# Altium schematic sheet 10_Power_Management.SchDoc: Gestión de energía
size A4; DrawnBy: Mateo Cárdenas; Revision: Rev A; SheetNumber: 2; SheetTotal: 7
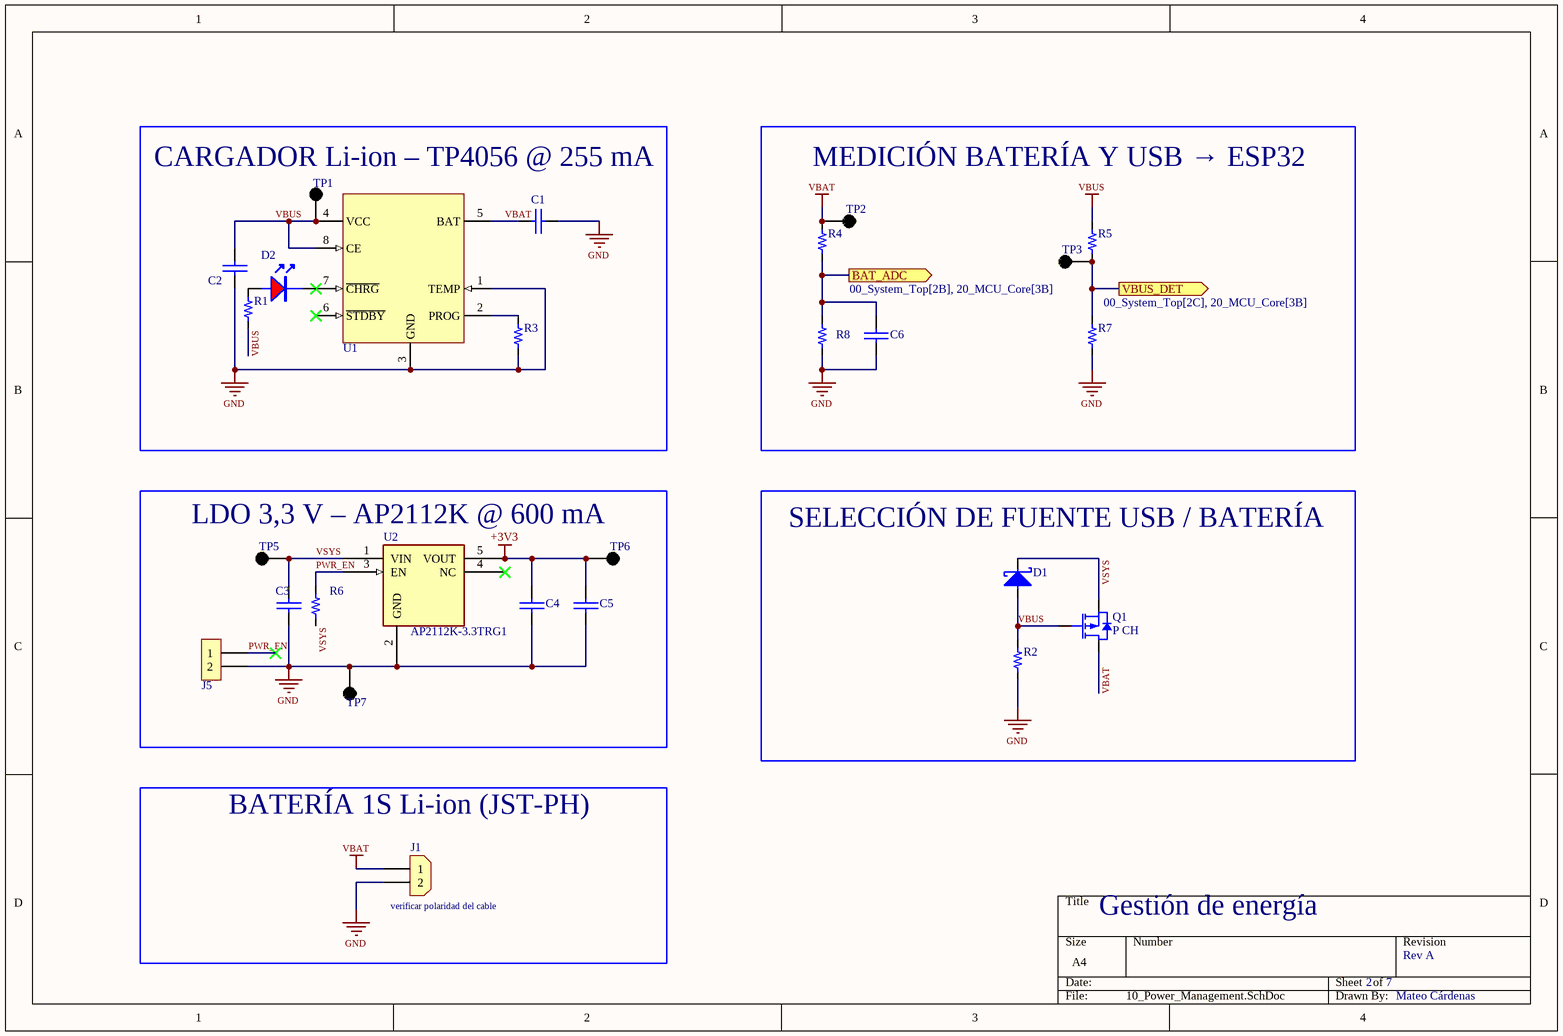
[diagram p0: 10_Power_Management.SchDoc]

## Parts
C1  10uF 10V  [0603_cap]  (value not drawn)
C2  10uF 10V  [0603_cap]  (value not drawn)
C3  10uF 10V  [0603_cap]  (value not drawn)
C4  10uF 10V  [0603_cap]  (value not drawn)
C5  0.1uF 50V  [0603_cap]  (value not drawn)
C6  0.1uF 50V  [0603_cap]  (value not drawn)
D1  40V 1A  [SOD_123]  (value not drawn)
D2  2V  [0805_LED]  (value not drawn)
J1  Connector 2pos  [CON_2x1_TH_2MM]  (value not drawn)
J5  2x1  [H_2x1_TH_100mil]  (value not drawn)  (no BOM)
Q1  P CH  [SOT_23_3]
R1  1k 1/10W  [0603_res]  (value not drawn)
R2  49k9 1/10W  [0603_res]  (value not drawn)
R3  4k7 1/10W  [0603_res]  (value not drawn)
R4  390k 1/10W  [0603_res]  (value not drawn)
R5  390k 1/10W  [0603_res]  (value not drawn)
R6  10k 1/10W  [0603_res]  (value not drawn)
R7  390k 1/10W  [0603_res]  (value not drawn)
R8  390k 1/10W  [0603_res]  (value not drawn)
TP1  Test Point  [Test Point]  (value not drawn)
TP2  Test Point  [Test Point]  (value not drawn)
TP3  Test Point  [Test Point]  (value not drawn)
TP5  Test Point  [Test Point]  (value not drawn)
TP6  Test Point  [Test Point]  (value not drawn)
TP7  Test Point  [Test Point]  (value not drawn)
U1  4.2V 1A  [SOIC_8_3.9mm]  (value not drawn)
U2  AP2112K-3.3TRG1  [SOT-23-5]

## Blocks framed on the sheet
CARGADOR Li-ion – TP4056 @ 255 mA: C1 C2 D2 R1 R3 TP1 U1
MEDICIÓN BATERÍA Y USB → ESP32: C6 R4 R5 R7 R8 TP2 TP3
LDO 3,3 V – AP2112K @ 600 mA: C3-C5 J5 R6 TP5-TP7 U2
SELECCIÓN DE FUENTE USB / BATERÍA: D1 Q1 R2
BATERÍA 1S Li-ion (JST-PH): J1

## Ports
BAT_ADC (out, see 00_System_Top[2B], 20_MCU_Core[3B]), VBUS_DET (out, see 00_System_Top[2C], 20_MCU_Core[3B])

## Nets
+3V3: C4.1 C5.1 TP6.1(TP?) U2.5(VOUT)
GND: C1.1 C2.2 C3.2 C4.2 C5.2 C6.1 J1.2 J5.2 R2.1 R3.1 R7.2 R8.1 TP7.1(TP?) U1.1(TEMP) U1.3(GND) U2.2(GND)
VBAT: C1.2 J1.1 Q1.3(D) R4.2 TP2.1(TP?) U1.5(BAT)
VBUS: C2.1 D1.2 Q1.1(G) R1.2 R2.2 R5.1 TP1.1(TP?) U1.4(VCC) U1.8(CE)
BAT_ADC: C6.2 R4.1 R8.2 ; port BAT_ADC
PWR_EN: J5.1 R6.2 U2.3(EN)
VBUS_DET: R5.2 R7.1 TP3.1(TP?) ; port VBUS_DET
VSYS: C3.1 D1.1 Q1.2(S) R6.1 TP5.1(TP?) U2.1(VIN)
NetD2_1: D2.1(A) R1.1
NetD2_2: D2.2 U1.7(~{CHRG})
NetR3_2: R3.2 U1.2(PROG)

Not connected (* = marked no-connect by the designer): U1 6(~{STDBY})*; U2 4(NC)*

## Notes on the sheet
- (near J1) verificar polaridad del cable

## Library data of the parts
C1-C4 = Cap_10uF_0603_10V: 10V 10uF X5R ±10% 0603 Multilayer Ceramic Capacitors MLCC - SMD/SMT ROHS; Manufacturer: CCTC; Manufacturer Part Number: TCC0603X5R106K100CT; Supplier 1: LCSC; Supplier Part Number 1: C380314; ComponentLink1Description: LCSC; ComponentLink1URL: https://www.lcsc.com/product-detail/Multilayer-Ceramic-Capacitors-MLCC-SMD-SMT_CCTC-TCC0603X5R106K100CT_C380314.html; Value: 10uF
C5 C6 = Cap_0.1uF_0603_50V: 50V 100nF Y5V -20%~+80% 0603 Multilayer Ceramic Capacitors MLCC - SMD/SMT ROHS; Manufacturer: Walsin Tech Corp; Manufacturer Part Number: 0603F104Z500CT; Supplier 1: LCSC; Supplier Part Number 1: C83060; ComponentLink1Description: LCSC; ComponentLink1URL: https://www.lcsc.com/product-detail/Multilayer-Ceramic-Capacitors-MLCC-SMD-SMT_Walsin-Tech-Corp-0603F104Z500CT_C83060.html; Value: 0.1uF
D1 = D_Schottky_40V_1A_SOD_123F: DIODE SCHOTTKY 40V 1A SOD123F; Manufacturer: Shanghai Prisemi Elec; Manufacturer Part Number: PSBD1DF40V1H; Supplier 1: LCSC; Supplier Part Number 1: C110730; ComponentLink1Description: LCSC; ComponentLink1URL: https://www.lcsc.com/product-detail/Switching-Diode_Shanghai-Prisemi-Elec-PSBD1DF40V1H_C110730.html
D2 = LED_0805_RED: LED RED CLEAR 0805 SMD; Manufacturer: XINGLIGHT; Manufacturer Part Number: XL-2012SURC; Supplier 1: LCSC; Supplier Part Number 1: C965812; ComponentLink1Description: LCSC; ComponentLink1URL: https://www.lcsc.com/product-detail/Light-Emitting-Diodes-LED_XINGLIGHT-XL-2012SURC_C965812.html
J1 = Con_2x1_TH_JST_2MM: 2POS 2MM; Manufacturer: JST; Manufacturer Part Number: S2B-PH-K-S(LF)(SN); Supplier 1: LCSC; Supplier Part Number 1: C173752; ComponentLink1Description: Digi-Key; ComponentLink1URL: https://lcsc.com/product-detail/Wire-To-Board-Connector_JST-S2B-PH-K-S-LF-SN_C173752.html
J5 = H_Male_2x1_TH_100mil: ComponentLink1Description: LCSC
Q1 = Q_PFET_30V_3A_SOT23: MOSFET P-CH 20V 3A SOT23; Manufacturer: ALLPOWER(ShenZhen Quan Li Semiconductor); Manufacturer Part Number: AP2301; Supplier 1: LCSC; Supplier Part Number 1: C385296; ComponentLink1Description: LCSC; ComponentLink1URL: https://www.lcsc.com/product-detail/MOSFETs_ALLPOWER-ShenZhen-Quan-Li-Semiconductor-AP2301_C385296.html
R1 = Res_1k_0603_1/10W: RES SMD 1k OHM 5% 1/10W 0603; Manufacturer: FOJAN; Manufacturer Part Number: FRC0603J102 TS; ComponentLink1URL: https://www.lcsc.com/product-detail/Chip-Resistor-Surface-Mount_FOJAN-FRC0603J102-TS_C2907113.html; Supplier 1: LCSC; Supplier Part Number 1: C2907113; ComponentLink1Description: LCSC; Value: 1k
R2 = Res_49k9_0603_1/10W: 100mW Thick Film Resistor 75V ±100ppm/℃ ±1% 49.9kΩ 0603 Chip Resistor - Surface Mount ROHS; Manufacturer: YAGEO; Manufacturer Part Number: RC0603FR-0749K9L; ComponentLink1URL: https://lcsc.com/product-detail/Chip-Resistor-Surface-Mount_YAGEO-RC0603FR-0749K9L_C114624.html; Supplier 1: LCSC; Supplier Part Number 1: C114624; ComponentLink1Description: LCSC; Value: 49k9
R3 = Res_4k7_0603_1/10W: 100mW Thick Film Resistor 75V ±1% 4.7kΩ 0603 Chip Resistor - Surface Mount ROHS; Manufacturer: VO; Manufacturer Part Number: SCR0603F4K7; ComponentLink1URL: https://lcsc.com/product-detail/Chip-Resistor-Surface-Mount_VO-SCR0603F4K7_C3016318.html; Supplier 1: LCSC; Supplier Part Number 1: C3016318; ComponentLink1Description: LCSC; Value: 4k7
R4 R5 R7 R8 = Res_390k_0603_1/10W: 100mW Thick Film Resistor 75V ±100ppm/℃ ±1% 390kΩ 0603 Chip Resistor - Surface Mount ROHS; Manufacturer: YAGEO; Manufacturer Part Number: RC0603FR-07390KL; ComponentLink1URL: https://lcsc.com/product-detail/Chip-Resistor-Surface-Mount_YAGEO-RC0603FR-07390KL_C137735.html; Supplier 1: LCSC; Supplier Part Number 1: C137735; ComponentLink1Description: LCSC; Value: 390k
R6 = Res_10k_0603_1/10W: RES SMD 10k OHM 5% 1/10W 0603; Manufacturer: FOJAN; Manufacturer Part Number: FRC0603J103TS; ComponentLink1URL: https://www.lcsc.com/product-detail/Chip-Resistor-Surface-Mount_FOJAN-FRC0603J103TS_C2930027.html; Supplier 1: LCSC; Supplier Part Number 1: C2930027; ComponentLink1Description: LCSC; Value: 10k
TP1-TP3 TP5-TP7 = Test Point: PC TEST POINT; Manufacturer: KOA Speer Electronics, Inc.; Manufacturer Part Number: RCWCTE
U1 = IC_BAT_CHG_4.2V_1A: -300mV~8V Lithium-ion/Polymer 1 1A ESOP-8 Battery Management ROHS; Manufacturer: YONGYUTAI; Manufacturer Part Number: TP4056; Supplier 1: LCSC; Supplier Part Number 1: C20199357; ComponentLink1Description: LCSC; ComponentLink1URL: https://lcsc.com/product-detail/Battery-Management_YONGYUTAI-TP4056_C20199357.html
U2 = AP2112K-3.3TRG1: Diodes AP2112 600 mA low-dropout 3.3 V regulator, SOT-23-5 (SOT25). EN high = on.; Manufacturer: Diodes Incorporated; Verification: Pinout and land pattern from datasheet; not yet built or tested; Manufacturer Part Number: AP2112K-3.3TRG1; Datasheet: DS39724 Rev. 2-2 (June 2017)